# Altium schematic sheet SFY_ADA_4G_03_MODEM_2.SchDoc: MODEM 2/2
size 297 x 209 mm; SPICEModelCacheCYJJXQYR: <root> / <DocumentId>CYJJXQYR</DocumentId> / <CacheFrame Number="0"> / <Model Name="0603_742792651_600ohm" Kind="CKT"> / <Text>******* / .subckt 0603_742792651_600ohm 1 2 / Rp 1 2 813 / Cp 1 2 0.617p / Rs 1 N3 0.2 / L1 N3 2 1.384u / .ends 0603_742792651_600ohm</Text> / </Model> / </CacheFrame> / </root>; SheetNumber: 4; SheetTotal: 4
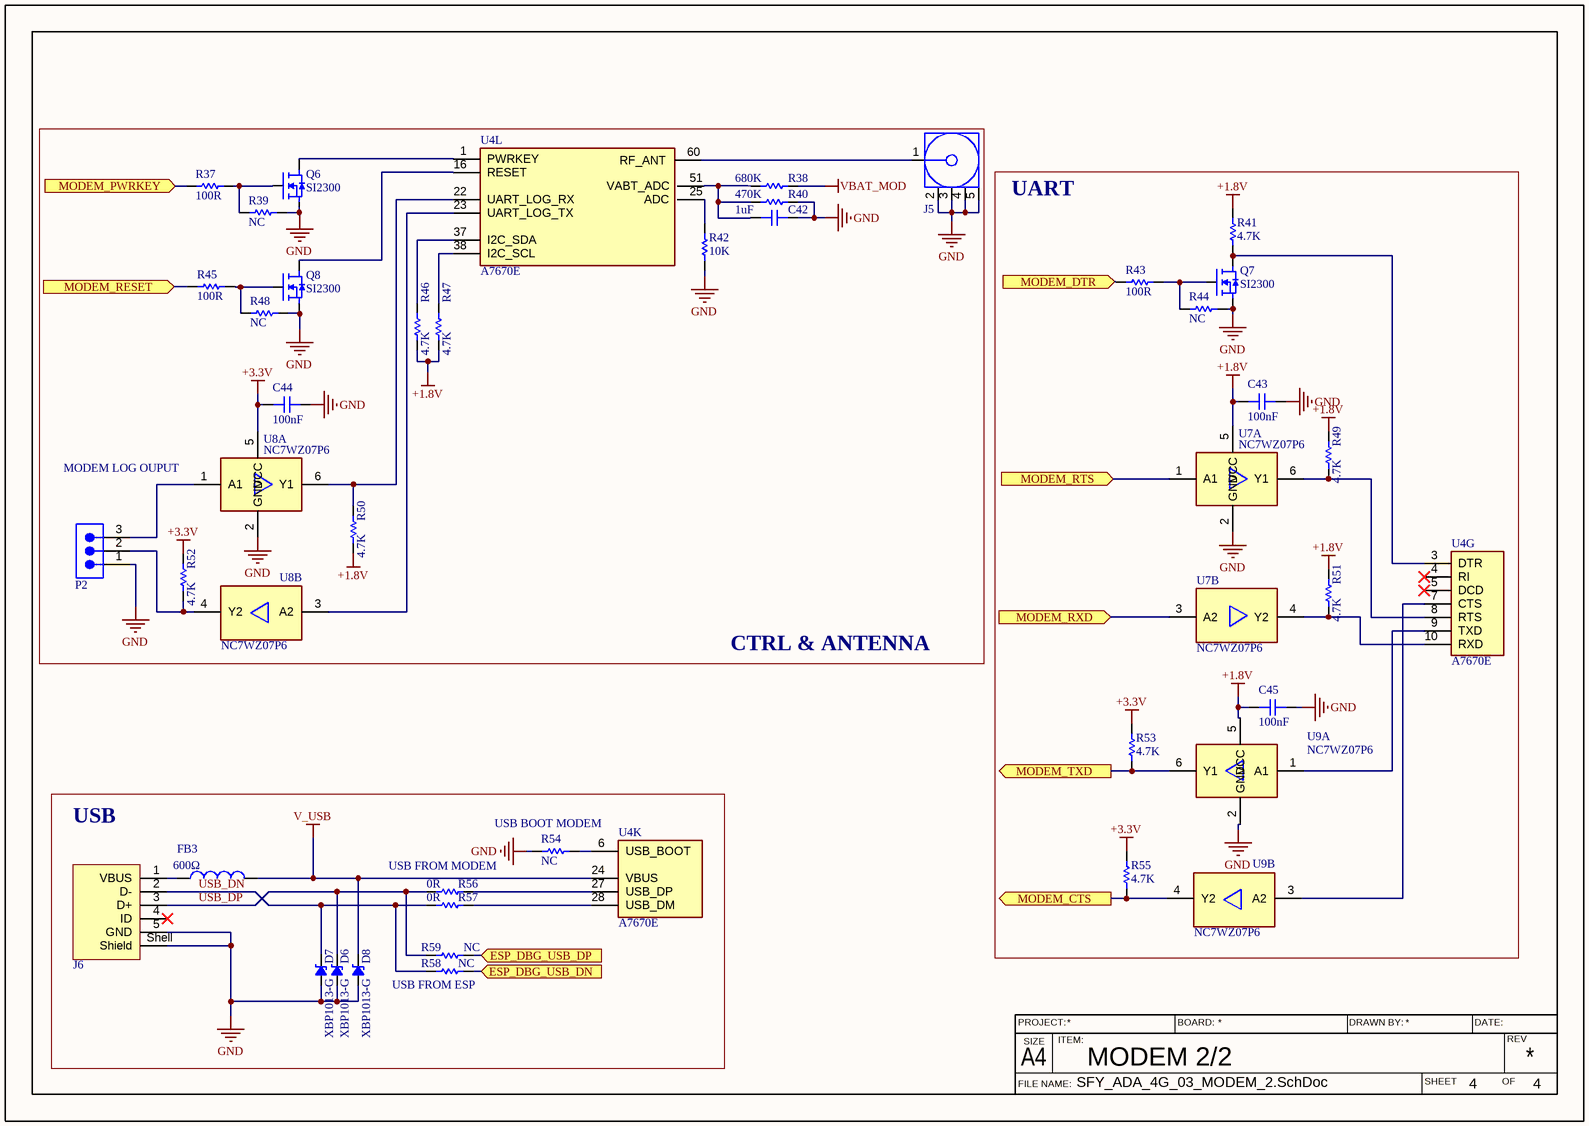
[diagram p0: SFY_ADA_4G_03_MODEM_2.SchDoc]

## Parts
C42  1uF  [C_0603_H_0.8_M]
C43  100nF  [C_0603_H_0.8_M]
C44  100nF  [C_0603_H_0.8_M]
C45  100nF  [C_0603_H_0.8_M]
D6  XBP1013-G  [SOD-323-2]
D7  XBP1013-G  [SOD-323-2]
D8  XBP1013-G  [SOD-323-2]
FB3  600Ω  [WE-CBF_0603_L1.6W0.8H0.8_HC]
J5  60311042114502  [60311042114502]  (value not drawn)
J6  65100516121  [65100516121]  (value not drawn)
P2  61300311121  [61300311121]  (value not drawn)
Q6  SI2300  [SOT23-3]
Q7  SI2300  [SOT23-3]
Q8  SI2300  [SOT23-3]
R37  100R  [R_0603_H_0.45_M]
R38  680K  [R_0603_H_0.45_M]
R39  NC  [R_0603_H_0.45_M]
R40  470K  [R_0603_H_0.45_M]
R41  4.7K  [R_0603_H_0.45_M]
R42  10K  [R_0603_H_0.45_M]
R43  100R  [R_0603_H_0.45_M]
R44  NC  [R_0603_H_0.45_M]
R45  100R  [R_0603_H_0.45_M]
R46  4.7K  [R_0603_H_0.45_M]
R47  4.7K  [R_0603_H_0.45_M]
R48  NC  [R_0603_H_0.45_M]
R49  4.7K  [R_0603_H_0.45_M]
R50  4.7K  [R_0603_H_0.45_M]
R51  4.7K  [R_0603_H_0.45_M]
R52  4.7K  [R_0603_H_0.45_M]
R53  4.7K  [R_0603_H_0.45_M]
R54  NC  [R_0603_H_0.45_M]
R55  4.7K  [R_0603_H_0.45_M]
R56  0R  [R_0603_H_0.45_M]
R57  0R  [R_0603_H_0.45_M]
R58  NC  [R_0603_H_0.45_M]
R59  NC  [R_0603_H_0.45_M]
U4  A7670E  [A7670CLNSC]  (parts G,K,L of 12)
U7  NC7WZ07P6  [SOT65P210X110-6N]  (parts A,B of 2)
U8  NC7WZ07P6  [SOT65P210X110-6N]  (parts A,B of 2)
U9  NC7WZ07P6  [SOT65P210X110-6N]  (parts A,B of 2)

## Blocks framed on the sheet
CTRL & ANTENNA: C42 C44 J5 P2 Q6 Q8 R37-R40 R42 R45-R48 R50 R52 U4 U8
UART: C43 C45 Q7 R41 R43 R44 R49 R51 R53 R55 U4 U7 U9
USB: D6-D8 FB3 J6 R54 R56-R59 U4

## Ports
ESP_DBG_USB_DN (in, see 01_ESP[3C]), ESP_DBG_USB_DP (in, see 01_ESP[3C]), MODEM_CTS (out, see 01_ESP[5B]), MODEM_DTR (in, see 01_ESP[5B]), MODEM_PWRKEY (in, see 01_ESP[5C]), MODEM_RESET (in, see 01_ESP[5B]), MODEM_RTS (in, see 01_ESP[5B]), MODEM_RXD (in, see 01_ESP[5B]), MODEM_TXD (out, see 01_ESP[5B])

## Nets
+1.8V: C43.1 C45.1 R41.2 R46.1 R47.1 R49.2 R50.2 R51.2 U7.5(VCC) U9.5(VCC)
+3.3V: C44.1 R52.2 R53.2 R55.2 U8.5(VCC)
GND: C42.2 C43.2 C44.2 C45.2 D6.1(A) D7.1(A) D8.1(A) J5.2(GND) J5.3(GND) J5.4(GND) J5.5(GND) J6.5(GND) J6.Shell(Shield) P2.1 Q6.2(S) Q7.2(S) Q8.2(S) R39.2 R40.2 R42.1 R44.2 R48.2 R54.1 U7.2(GND) U8.2(GND) U9.2(GND)
V_USB: D8.2(K) FB3.2 U4.24(VBUS)
VBAT_MOD: R38.2
ESP_DBG_USB_DN: R58.1 ; port ESP_DBG_USB_DN
ESP_DBG_USB_DP: R59.1 ; port ESP_DBG_USB_DP
MODEM_CTS: R55.1 U9.4(Y2) ; port MODEM_CTS
MODEM_DTR: R43.1 ; port MODEM_DTR
MODEM_PWRKEY: R37.1 ; port MODEM_PWRKEY
MODEM_RESET: R45.1 ; port MODEM_RESET
MODEM_RTS: U7.1(A1) ; port MODEM_RTS
MODEM_RXD: U7.3(A2) ; port MODEM_RXD
MODEM_TXD: R53.1 U9.6(Y1) ; port MODEM_TXD
USB_DN: D7.2(K) J6.2(D-) R57.1 R58.2
USB_DP: D6.2(K) J6.3(D+) R56.1 R59.2
NetC42_1: C42.1 R38.1 R40.1 U4.51(VABT_ADC)
NetFB3_1: FB3.1 J6.1(VBUS)
NetJ5_1: J5.1(Signal) U4.60(RF_ANT)
NetP2_2: P2.2 R52.1 U8.4(Y2)
NetP2_3: P2.3 U8.1(A1)
NetQ6_1: Q6.1(G) R37.2 R39.1
NetQ6_3: Q6.3(D) U4.1(PWRKEY)
NetQ7_1: Q7.1(G) R43.2 R44.1
NetQ7_3: Q7.3(D) R41.1 U4.3(DTR)
NetQ8_1: Q8.1(G) R45.2 R48.1
NetQ8_3: Q8.3(D) U4.16(RESET)
NetR42_2: R42.2 U4.25(ADC)
NetR46_2: R46.2 U4.37(I2C_SDA)
NetR47_2: R47.2 U4.38(I2C_SCL)
NetR49_1: R49.1 U4.8(RTS) U7.6(Y1)
NetR50_1: R50.1 U4.22(UART_LOG_RX) U8.6(Y1)
NetR51_1: R51.1 U4.10(RXD) U7.4(Y2)
NetR54_2: R54.2 U4.6(USB_BOOT)
NetR56_2: R56.2 U4.27(USB_DP)
NetR57_2: R57.2 U4.28(USB_DM)
NetU4_7: U4.7(CTS) U9.3(A2)
NetU4_9: U4.9(TXD) U9.1(A1)
NetU4_23: U4.23(UART_LOG_TX) U8.3(A2)

Not connected (* = marked no-connect by the designer): J6 4(ID)*; U4 4(RI)* 5(DCD)*

## Notes on the sheet
- MODEM LOG OUPUT
- (near R56) USB FROM MODEM
- (near R54) USB BOOT MODEM
- (near R58) USB FROM ESP
- FILE NAME:
- PROJECT:
- A4
- SIZE
- ITEM:
- BOARD:
- DRAWN BY:
- SHEET
- DATE:
- OF
- REV

## Library data of the parts
C42-C45 = C: TYPE / TOLERANCE / VOLTAGE / PACKAGE; Symbol_Valid: 20260706; Manufacturer_Name: *; Manufacturer_Ref: *; Keolabs_ref: *
D6-D8 = D_TVS_UNIDIR: 5V; Symbol_Valid: 20260706; Manufacturer_Name: *; Manufacturer_Ref: *; Keolabs_Ref: *
FB3 = 742792651: WE-CBF SMT EMI Suppression Ferrite Bead, size 0603, 600Ω, 1A; Manufacturer: Wurth Elektronik; Case/Size Code: 0603; DC Resistance Max: 0.2Ω; Impedance Max: 800Ω; Impedance Max Test Condition: 200MHz; Type: High Current; Manufacturer Part Number: 742792651; Category: Ferrites for PCB Assembly; Match Code: WE-CBF; ComponentLink1Description: Website Link; ComponentLink1URL: https://www.we-online.com/redexpert/article/742792651?ad; ComponentLink2Description: Datasheet Link; ComponentLink2URL: https://www.we-online.com/redexpert/spec/742792651?ad; Mount: Surface Mount; Min Operating Temperature: -55°C; Max Operating Temperature: 125°C; Packaging: Tape and Reel; Length: 1.6mm; Width: 0.8mm; Height: 0.8mm; Impedance @100MHz: 600Ω; Rated Current: 1A
J5 = 60311042114502: WR-SMA Connector, PCB THT Jack, Rear Mount Bulkhead, DC~12.4GHz, 50Ohm; Manufacturer: Wurth Elektronik; Center Contact Diameter: 1.27mm; Connector Type: SMA; Interface Type: MIL-STD-348; Manufacturer Part Number: 60311042114502; Category: Coaxial Connectors; Match Code: WR-SMA; ComponentLink1Description: Website Link; ComponentLink1URL: https://www.we-online.com/redexpert/article/60311042114502?ad; ComponentLink2Description: Datasheet Link; ComponentLink2URL: https://www.we-online.com/redexpert/spec/60311042114502?ad; Mount: Through Hole; Operating Temperature Max: 165°C; Operating Temperature Min: -65°C; Packaging: Tray; Frequency Range: DC~12.4GHz; Gender: Jack; Impedance: 50Ohm; Orientation: Right Angle
J6 = 65100516121: WR-COM Mini USB 2.0 Type B SMT Horizontal 5 Contacts; Manufacturer: Wurth Elektronik; Match Code: WR-USB; Gender: Receptacle; Interface Type: Type B; Number of Ports: 1; Rated Current: 1A; Working Voltage: 30V (AC); Manufacturer Part Number: 65100516121; Category: Input/Output Connectors; ComponentLink1Description: Website Link; ComponentLink1URL: https://www.we-online.com/redexpert/article/65100516121?ad; ComponentLink2Description: Datasheet Link; ComponentLink2URL: https://www.we-online.com/redexpert/spec/65100516121?ad; Mount: Surface Mount; Operating Temperature Max: 105°C; Operating Temperature Min: -40°C; Packaging: Tape and Reel & Mylar; Application: Mini USB 2.0; Number of Pins: 5; Orientation: Horizontal
P2 = 61300311121: WR-PHD Pin Header, THT, Vertical, pitch 2.54mm, 1 Row, 3P; Manufacturer: Wurth Elektronik; Contact Resistance: 20mΩ; Rated Current: 3A; Working Voltage: 250V; Withstanding Voltage: 500V; ComponentLink1Description: Website Link; ComponentLink1URL: https://www.we-online.com/redexpert/article/61300311121?ad; ComponentLink2Description: Datasheet Link; ComponentLink2URL: https://www.we-online.com/redexpert/spec/61300311121?ad; Manufacturer Part Number: 61300311121; Category: Board-to-Board Connectors; Match Code: WR-PHD; Mount: Through Hole; Operating Temperature Max: 105°C; Operating Temperature Min: -40°C; Packaging: Bag; Gender: Pin Header; Number of Pins: 3; Number of Rows: 1; Orientation: Vertical; Pitch: 2.54mm
Q6-Q8 = T_MOS_D_N: CURRENT / VOLTAGE / RDSON / PACKAGE; Symbol_Valid: 20260706; Manufacturer_Name: *; Manufacturer_Ref: *; Keolabs_Ref: *
R37-R59 = R: TOLERANCE / POWER / VOLTAGE / PACKAGE; Symbol_Valid: 20260706; Manufacturer_Name: *; Manufacturer_Ref: *; Keolabs_Ref: *
U4 = A7670E: Integrated Circuit; Manufacturer_Name: SIMCOM; Manufacturer_Part_Number: A7670C-LNSC; Datasheet Link: https://nostris.ee/pdf/A7670%20Series%20Hardware%20Design_V1.00.pdf; Height: 2.77mm
U7-U9 = NC7WZ07P6: Undefined or Miscellaneous; Manufacturer_Name: onsemi; Datasheet Link: https://componentsearchengine.com/Datasheets/2/NC7WZ07P6.pdf; Height: 1.1mm; Manufacturer_Part_Number: NC7WZ07P6; Mouser Part Number: 512-NC7WZ07P6; Mouser Price/Stock: https://www.mouser.co.uk/ProductDetail/onsemi-Fairchild/NC7WZ07P6?qs=lI63Maeh00G%252BzlGPlSifpQ%3D%3D; Arrow Part Number: NC7WZ07P6; Arrow Price/Stock: https://www.arrow.com/en/products/nc7wz07p6/on-semiconductor